# Altium project arm_board_2024_final.PrjPcb
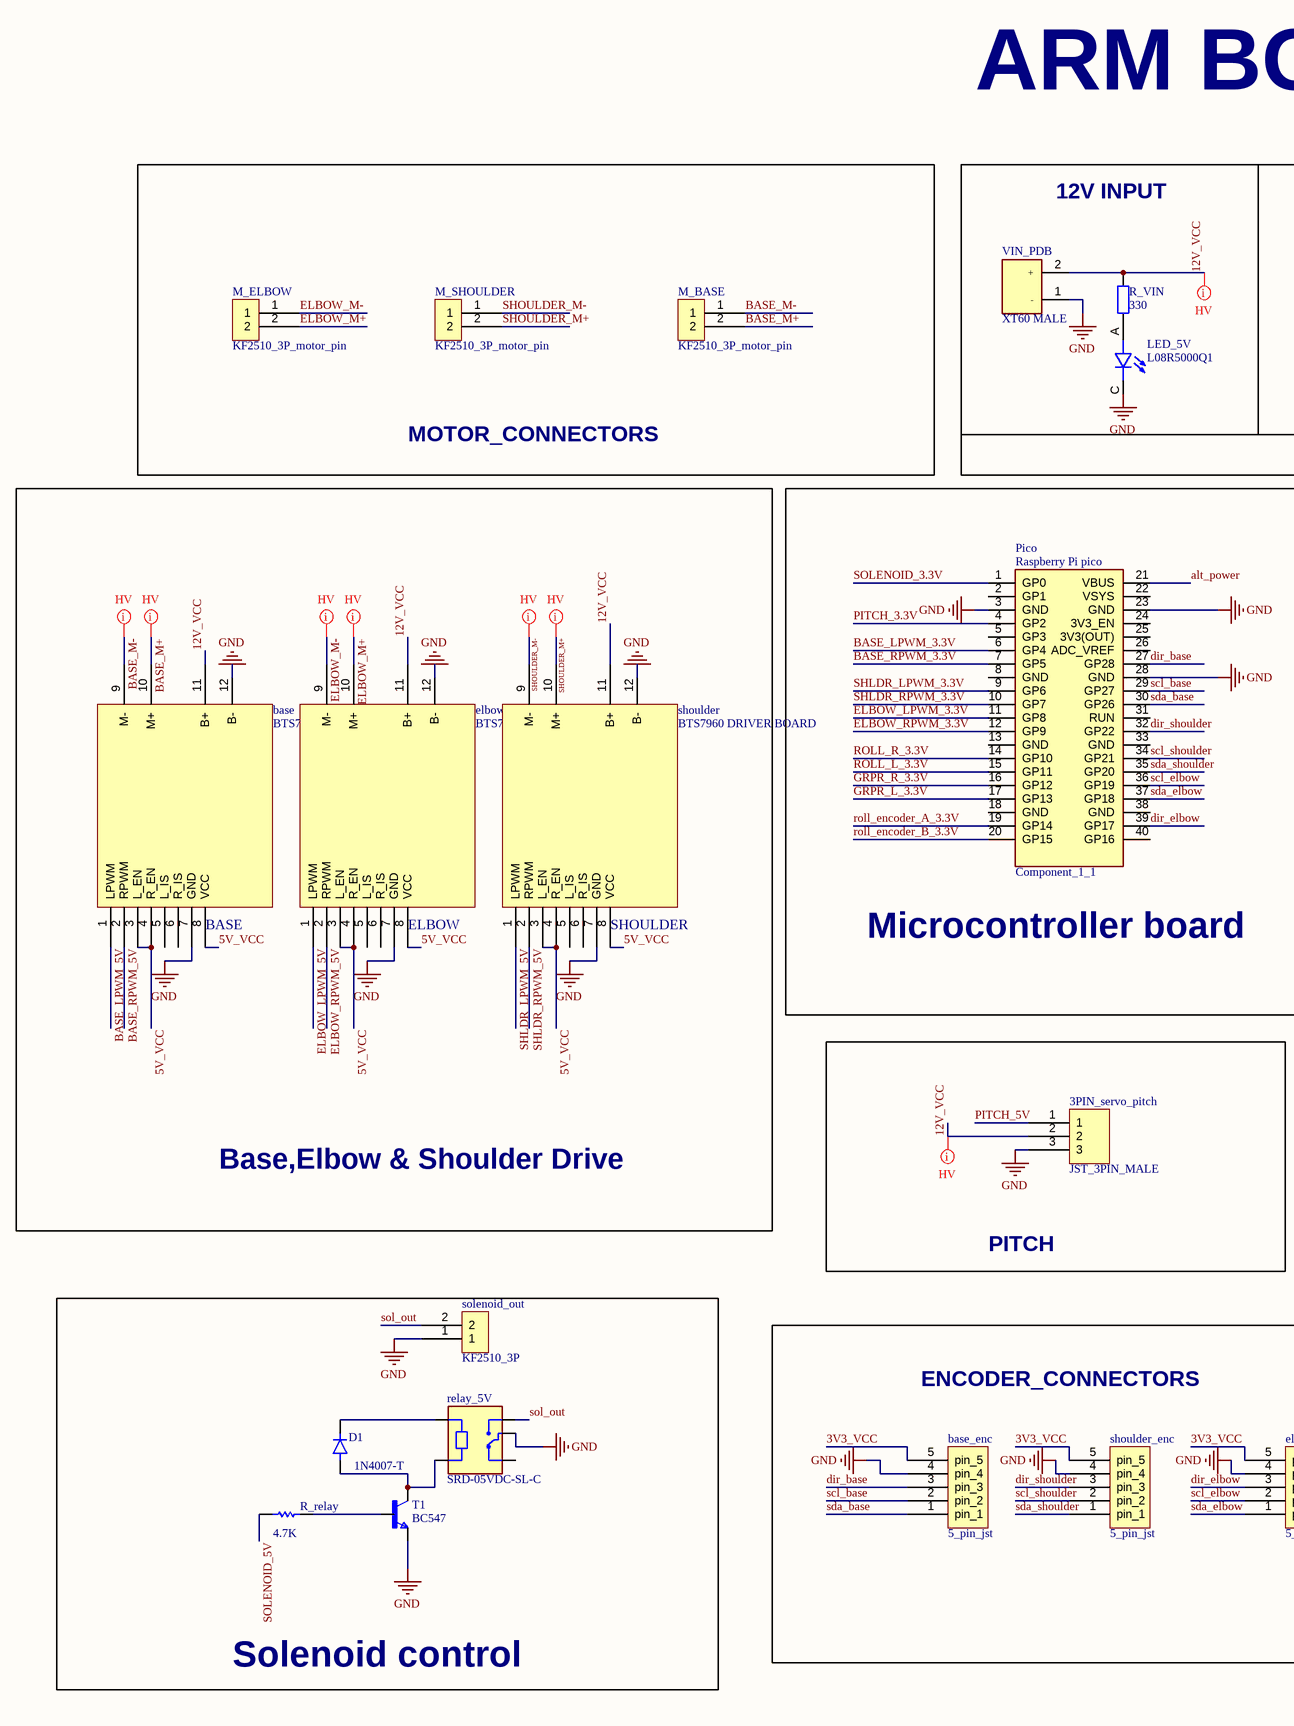
[diagram p0: ARM_FINAL.SchDoc, left]
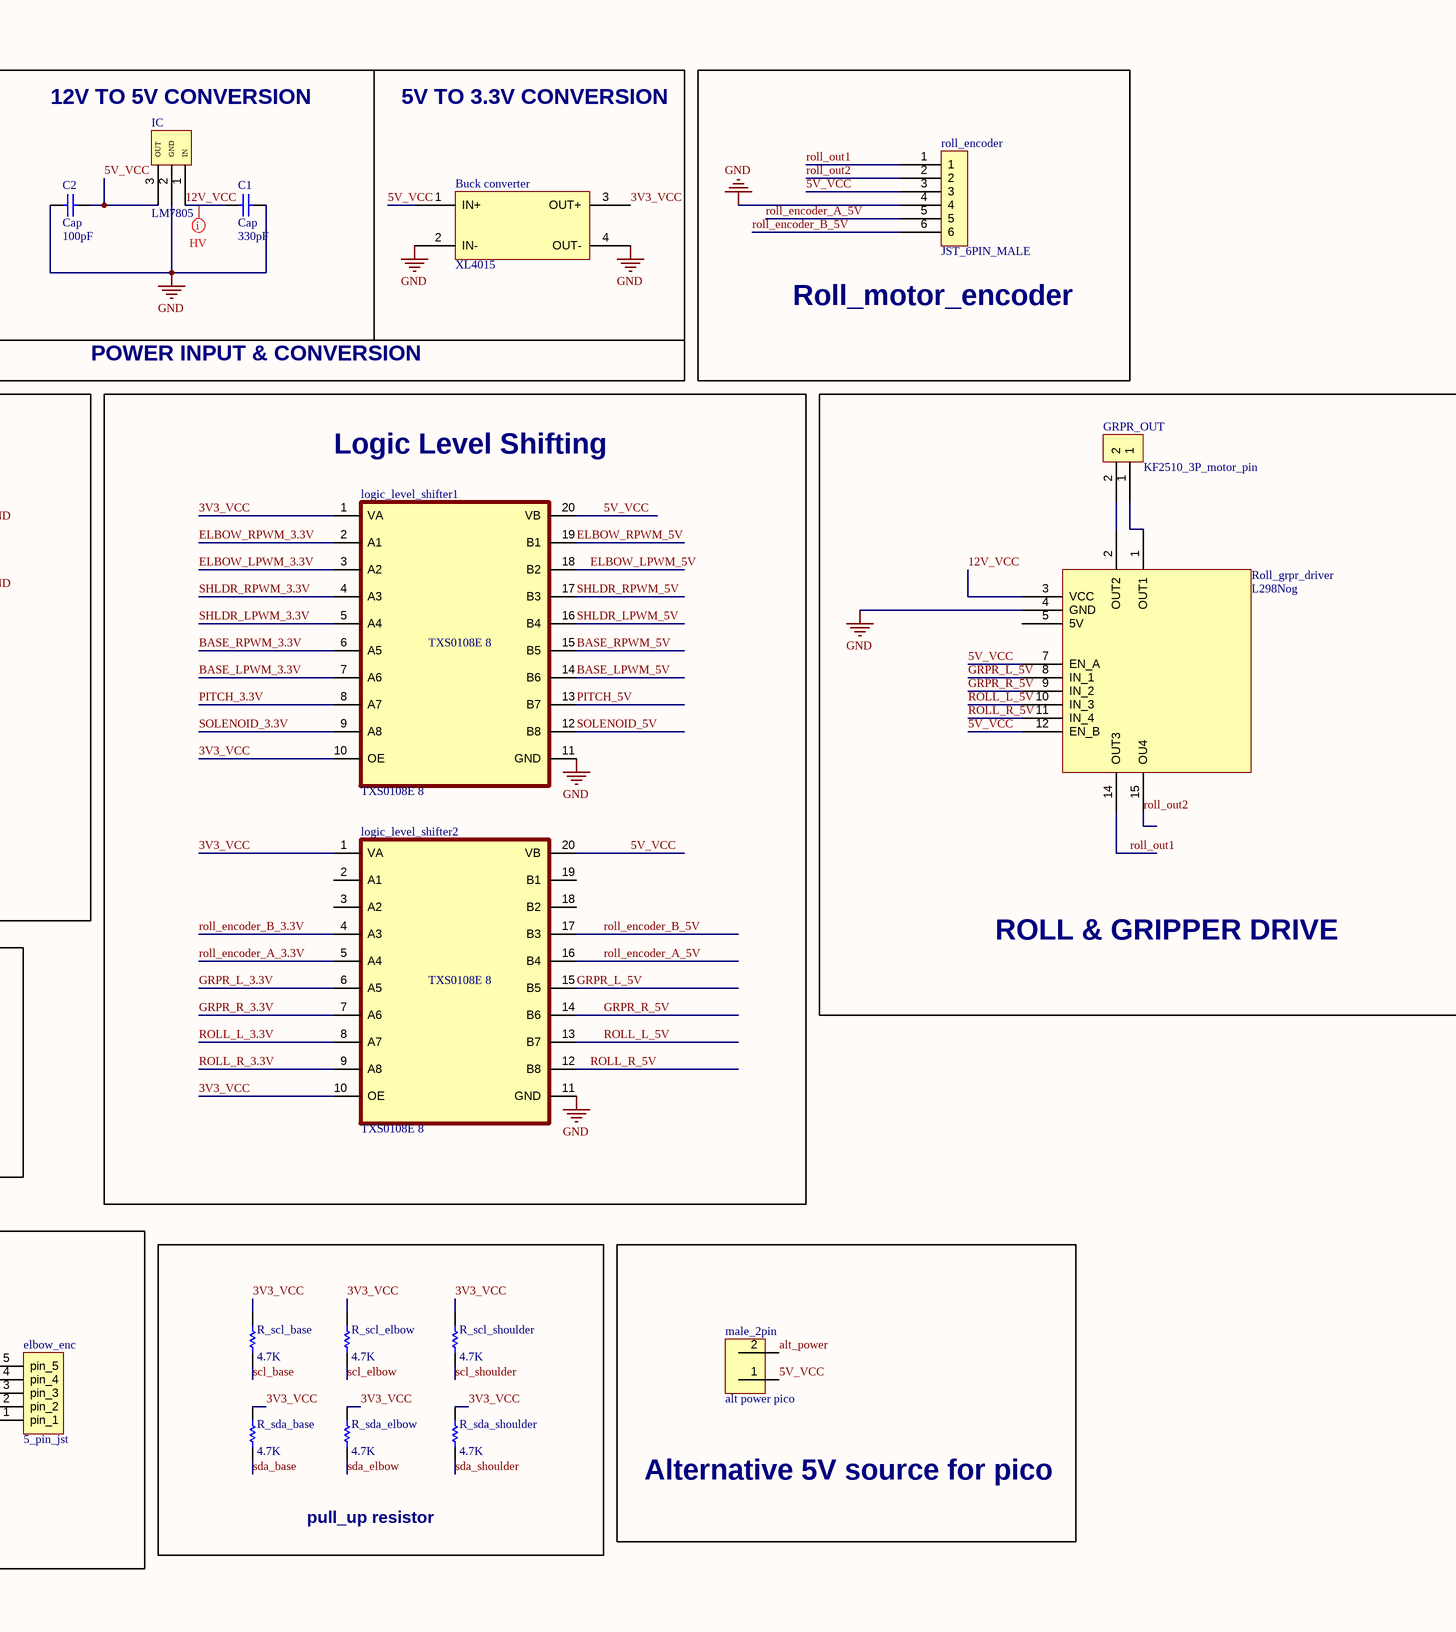
[diagram p1: ARM_FINAL.SchDoc, right]
1 sheet, 35 parts. Net scope: global (net labels, ports and power ports of the same name join across sheets).
Board file: final_arm.PcbDoc

## Sheet ARM_FINAL.SchDoc
size 863 x 558 mm; SheetNumber: 1; SheetTotal: 1

### Parts
3PIN_servo_pitch  JST_3PIN_MALE  [JST_3PIN_MALE]
base  BTS7960 DRIVER BOARD  [BTS7960_DRIVER_BOARD]
base_enc  5_pin_jst  [5pin_jst]
Buck_converter  XL4015  [XL4015_BL]
C1  Cap  value 330pF  [RAD-0.3]
C2  Cap  value 100pF  [RAD-0.3]
D1  1N4007-T  [DIOAD780W78L463D236]
elbow  BTS7960 DRIVER BOARD  [BTS7960_DRIVER_BOARD]
elbow_enc  5_pin_jst  [5pin_jst]
GRPR_OUT  KF2510_3P_motor_pin  [PCBComponent_1]
IC  LM7805  [LM7805]
LED_5V  L08R5000Q1  [LEDRD254W57D500H1070]
logic_level_shifter1  TXS0108E 8  [llshifter]
logic_level_shifter2  TXS0108E 8  [llshifter]
M_BASE  KF2510_3P_motor_pin  [PCBComponent_1]
M_ELBOW  KF2510_3P_motor_pin  [PCBComponent_1]
M_SHOULDER  KF2510_3P_motor_pin  [PCBComponent_1]
male_2pin  alt power pico  [2pin_header]
Pico  Component_1_1  [PCBComponent_1 - duplicate]
R_relay  value 4.7K  [AXIAL-0.3]  (hidden comment: scl_base)
R_scl_base  value 4.7K  [AXIAL-0.3]  (hidden comment: scl_base)
R_scl_elbow  value 4.7K  [AXIAL-0.3]
R_scl_shoulder  value 4.7K  [AXIAL-0.3]  (hidden comment: Res1)
R_sda_base  value 4.7K  [AXIAL-0.3]  (hidden comment: Res1)
R_sda_elbow  value 4.7K  [AXIAL-0.3]  (hidden comment: Res1)
R_sda_shoulder  value 4.7K  [AXIAL-0.3]
R_VIN  value 330  [AXIAL-0.4]  (hidden comment: Res2)
relay_5V  SRD-05VDC-SL-C  [RELAY_SRD-05VDC-SL-C]
roll_encoder  JST_6PIN_MALE  [jst_6pin_male]
Roll_grpr_driver  L298Nog  [l298nog]
shoulder  BTS7960 DRIVER BOARD  [BTS7960_DRIVER_BOARD]
shoulder_enc  5_pin_jst  [5pin_jst]
solenoid_out  KF2510_3P  [PCBComponent_1]
T1  BC547  [TO92]
VIN_PDB  XT60 MALE  [XT60 MALE]

### Blocks framed on the sheet
MOTOR_CONNECTORS: M_BASE M_ELBOW M_SHOULDER
Roll_motor_encoder: roll_encoder
Microcontroller board: Pico
Logic Level Shifting: logic_level_shifter1 logic_level_shifter2
ROLL & GRIPPER DRIVE: GRPR_OUT Roll_grpr_driver
PITCH: 3PIN_servo_pitch
Solenoid control: D1 R_relay relay_5V solenoid_out T1
ENCODER_CONNECTORS: base_enc elbow_enc shoulder_enc
pull_up resistor: R_scl_base R_scl_elbow R_scl_shoulder R_sda_base R_sda_elbow R_sda_shoulder
Alternative 5V source for pico: male_2pin

### Nets
GND: 3PIN_servo_pitch.3 base.7(GND) base.12(B-) base_enc.4(pin_4) Buck_converter.2(IN-) Buck_converter.4(OUT-) C1.2 C2.1 elbow.7(GND) elbow.12(B-) elbow_enc.4(pin_4) IC.2(GND) LED_5V.C logic_level_shifter1.11(GND) logic_level_shifter2.11(GND) Pico.3(GND) Pico.23(GND) Pico.28(GND) relay_5V.COM roll_encoder.4 Roll_grpr_driver.4(GND) shoulder.7(GND) shoulder.12(B-) shoulder_enc.4(pin_4) solenoid_out.1 T1.3(E) VIN_PDB.1(-)
3V3_VCC: base_enc.5(pin_5) Buck_converter.3(OUT+) elbow_enc.5(pin_5) logic_level_shifter1.1(VA) logic_level_shifter1.10(OE) logic_level_shifter2.1(VA) logic_level_shifter2.10(OE) R_scl_base.2 R_scl_elbow.2 R_scl_shoulder.2 R_sda_base.2 R_sda_elbow.2 R_sda_shoulder.2 shoulder_enc.5(pin_5)
5V_VCC: base.3(L_EN) base.4(R_EN) base.8(VCC) Buck_converter.1(IN+) C2.2 elbow.3(L_EN) elbow.4(R_EN) elbow.8(VCC) IC.3(OUT) logic_level_shifter1.20(VB) logic_level_shifter2.20(VB) male_2pin.1 roll_encoder.3 Roll_grpr_driver.7(EN_A) Roll_grpr_driver.12(EN_B) shoulder.3(L_EN) shoulder.4(R_EN) shoulder.8(VCC)
12V_VCC: 3PIN_servo_pitch.2 base.11(B+) C1.1 elbow.11(B+) IC.1(IN) R_VIN.2 Roll_grpr_driver.3(VCC) shoulder.11(B+) VIN_PDB.2(+)
alt_power: male_2pin.2 Pico.21(VBUS)
BASE_LPWM_3.3V: logic_level_shifter1.7(A6) Pico.6(GP4)
BASE_LPWM_5V: base.1(LPWM) logic_level_shifter1.14(B6)
BASE_M+: base.10(M+) M_BASE.2
BASE_M-: base.9(M-) M_BASE.1
BASE_RPWM_3.3V: logic_level_shifter1.6(A5) Pico.7(GP5)
BASE_RPWM_5V: base.2(RPWM) logic_level_shifter1.15(B5)
dir_base: base_enc.3(pin_3) Pico.27(GP28)
dir_elbow: elbow_enc.3(pin_3) Pico.39(GP17)
dir_shoulder: Pico.32(GP22) shoulder_enc.3(pin_3)
ELBOW_LPWM_3.3V: logic_level_shifter1.3(A2) Pico.11(GP8)
ELBOW_LPWM_5V: elbow.1(LPWM) logic_level_shifter1.18(B2)
ELBOW_M+: elbow.10(M+) M_ELBOW.2
ELBOW_M-: elbow.9(M-) M_ELBOW.1
ELBOW_RPWM_3.3V: logic_level_shifter1.2(A1) Pico.12(GP9)
ELBOW_RPWM_5V: elbow.2(RPWM) logic_level_shifter1.19(B1)
GRPR_L_3.3V: logic_level_shifter2.6(A5) Pico.17(GP13)
GRPR_L_5V: logic_level_shifter2.15(B5) Roll_grpr_driver.8(IN_1)
GRPR_R_3.3V: logic_level_shifter2.7(A6) Pico.16(GP12)
GRPR_R_5V: logic_level_shifter2.14(B6) Roll_grpr_driver.9(IN_2)
PITCH_3.3V: logic_level_shifter1.8(A7) Pico.4(GP2)
PITCH_5V: 3PIN_servo_pitch.1 logic_level_shifter1.13(B7)
roll_encoder_A_3.3V: logic_level_shifter2.5(A4) Pico.19(GP14)
roll_encoder_A_5V: logic_level_shifter2.16(B4) roll_encoder.5
roll_encoder_B_3.3V: logic_level_shifter2.4(A3) Pico.20(GP15)
roll_encoder_B_5V: logic_level_shifter2.17(B3) roll_encoder.6
ROLL_L_3.3V: logic_level_shifter2.8(A7) Pico.15(GP11)
ROLL_L_5V: logic_level_shifter2.13(B7) Roll_grpr_driver.10(IN_3)
roll_out1: roll_encoder.1 Roll_grpr_driver.14(OUT3)
roll_out2: roll_encoder.2 Roll_grpr_driver.15(OU4)
ROLL_R_3.3V: logic_level_shifter2.9(A8) Pico.14(GP10)
ROLL_R_5V: logic_level_shifter2.12(B8) Roll_grpr_driver.11(IN_4)
scl_base: base_enc.2(pin_2) Pico.29(GP27) R_scl_base.1
scl_elbow: elbow_enc.2(pin_2) Pico.36(GP19) R_scl_elbow.1
scl_shoulder: Pico.34(GP21) R_scl_shoulder.1 shoulder_enc.2(pin_2)
sda_base: base_enc.1(pin_1) Pico.30(GP26) R_sda_base.1
sda_elbow: elbow_enc.1(pin_1) Pico.37(GP18) R_sda_elbow.1
sda_shoulder: Pico.35(GP20) R_sda_shoulder.1 shoulder_enc.1(pin_1)
SHLDR_LPWM_3.3V: logic_level_shifter1.5(A4) Pico.9(GP6)
SHLDR_LPWM_5V: logic_level_shifter1.16(B4) shoulder.1(LPWM)
SHLDR_RPWM_3.3V: logic_level_shifter1.4(A3) Pico.10(GP7)
SHLDR_RPWM_5V: logic_level_shifter1.17(B3) shoulder.2(RPWM)
SHOULDER_M+: M_SHOULDER.2 shoulder.10(M+)
SHOULDER_M-: M_SHOULDER.1 shoulder.9(M-)
sol_out: relay_5V.NO solenoid_out.2
SOLENOID_3.3V: logic_level_shifter1.9(A8) Pico.1(GP0)
SOLENOID_5V: logic_level_shifter1.12(B8) R_relay.2
NetD1_A: D1.A relay_5V.A2 T1.1(C)
NetD1_K: D1.K relay_5V.A1
NetGRPR_OUT_1: GRPR_OUT.1 Roll_grpr_driver.1(OUT1)
NetGRPR_OUT_2: GRPR_OUT.2 Roll_grpr_driver.2(OUT2)
NetLED_5V_A: LED_5V.A R_VIN.1
NetR_relay_1: R_relay.1 T1.2(B)

Not connected (* = marked no-connect by the designer): base 5(L_IS) 6(R_IS); elbow 5(L_IS) 6(R_IS); logic_level_shifter2 2(A1) 3(A2) 18(B2) 19(B1); Pico 2(GP1) 5(GP3) 8(GND) 13(GND) 18(GND) 22(VSYS) 24(3V3_EN) 25(3V3(OUT)) 26(ADC_VREF) 31(RUN) 33(GND) 38(GND) 40(GP16); relay_5V NC; Roll_grpr_driver 5(5V); shoulder 5(L_IS) 6(R_IS)

### Layout directives
net class HV: 12V_VCC, BASE_M+, BASE_M-, ELBOW_M+, ELBOW_M-, SHOULDER_M+, SHOULDER_M-

### Notes on the sheet
- ARM BOARD 2024
- 12V INPUT
- 12V TO 5V CONVERSION
- 5V TO 3.3V CONVERSION
- POWER INPUT & CONVERSION
- (near base) BASE
- (near elbow) ELBOW
- (near shoulder) SHOULDER
- Base,Elbow & Shoulder Drive
- DWG. NO.
- REV.
- SHT.
- REVISION
- DESCRIPTION
- DATE
- APPROVED
- THIS DOCUMENT AND THE DATA DISCLOSED HEREIN OR HEREWITH IS THE PROPERTY OF ALTIUM LIMITED AND MAY BE FREELY DISTRIBUTED IN WHOLE. NO RIGHTS ARE RESERVED OR EXPRESS OR IMPLIED WARANTEE GIVEN.
- ENG:
- DSN:
- APPROVALS
- PROJECT
- DOCUMENT REVISION:
- DESIGN ITEM:
- CHK:
- BOM:
- REFERENCE DOCUMENTS
- PROJECT REVISION:
- TITLE
- FAB DWG:
- PCB DWG:
- ASSY DWG:
- SCALE:
- SIZE
- D
- CAGE CODE
- FILE NAME
- DWG NO.
- SHEET
- OF
- REV
- (in symbol Component_1_1) Raspberry Pi pico

### Library data of the parts
3PIN_servo_pitch = JST_3PIN_MALE: JST 3PIN 2.54mm male
base elbow shoulder = BTS7960 DRIVER BOARD: MOTOR DRIVER, 12 PIN
C1 C2 = Cap: Capacitor; Published: 8-Jun-2000; LatestRevisionDate: 17-Jul-2002; LatestRevisionNote: Re-released for DXP Platform.; PackageReference: RAD-0.3; Publisher: Altium Limited; PackageDescription: Radial Cap, Thru-Hole; 2 Leads; 0.3 in Pin Spacing
D1 = 1N4007-T: Diode Standard 1A 1000V 1Vf DO41 | Diodes Inc 1N4007-T; MF: Diodes Incorporated; SnapEDA_Link: https://www.snapeda.com/parts/1N4007-T/Diodes+Inc./view-part/?ref=snap; Package: DO-41 Diodes Inc.; Value: *; MP: 1N4007-T; Check_prices: https://www.snapeda.com/parts/1N4007-T/Diodes+Inc./view-part/?ref=eda
GRPR_OUT M_BASE M_ELBOW M_SHOULDER solenoid_out = Component_1
LED_5V = L08R5000Q1: LED, 5MM, ORANGE; LED / Lamp Size: 5mm / T-1 3/4; LED Colour: Orange; Typ Luminous Intensity: 4.3mcd; Viewing Angle: ...; MF: LED Technology; Value: *; SnapEDA_Link: https://www.snapeda.com/parts/L08R5000Q1/LED+Technology/view-part/?ref=snap; MP: L08R5000Q1; Check_prices: https://www.snapeda.com/parts/L08R5000Q1/LED+Technology/view-part/?ref=eda; Availability: In Stock; Price: None; Package: None
logic_level_shifter1 logic_level_shifter2 = TXS0108E 8: 8ch logic level converter
male_2pin = Component_1: 2 pin header
R_relay R_scl_base R_scl_elbow R_scl_shoulder R_sda_base R_sda_elbow R_sda_shoulder = Res1: Resistor; Published: 8-Jun-2000; LatestRevisionDate: 17-Jul-2002; LatestRevisionNote: Re-released for DXP Platform.; PackageReference: AXIAL-0.3; Publisher: Altium Limited; PackageDescription: Axial Device, Thru-Hole; 2 Leads; 0.3 in Pin Spacing
R_VIN = Res2: Resistor; Published: 8-Jun-2000; LatestRevisionDate: 17-Jul-2002; LatestRevisionNote: Re-released for DXP Platform.; PackageReference: AXIAL-0.4; Publisher: Altium Limited; PackageDescription: Axial Device, Thru-Hole; 2 Leads; 0.4 in Pin Spacing
relay_5V = SRD-05VDC-SL-C: 5V Trigger Relay Module For Arduino And Raspberry Pi 5V Trigger Relay Module For Arduino And Raspberry Pi; MF: Songle Relay; Check_prices: https://www.snapeda.com/parts/SRD-05VDC-SL-C/Songle+Relay/view-part/?ref=eda; Value: *; Availability: Not in stock; Price: None; Package: NON STANDARD-5 Songle Relay; MP: SRD-05VDC-SL-C; SnapEDA_Link: https://www.snapeda.com/parts/SRD-05VDC-SL-C/Songle+Relay/view-part/?ref=snap
roll_encoder = JST_6PIN_MALE: JST 6PIN MALE 2.54mm
Roll_grpr_driver = L298Nog: MOTOR DRIVER BOARD, 15 PIN
T1 = BC547: Trans GP BJT NPN 45V 0.1A 500mW 3-Pin TO-92 T/R; MF: ON Semiconductor; SnapEDA_Link: https://www.snapeda.com/parts/BC547/Onsemi/view-part/?ref=snap; Package: None; Value: *; MP: BC547; Check_prices: https://www.snapeda.com/parts/BC547/Onsemi/view-part/?ref=eda
VIN_PDB = XT60 MALE: CONNECTOR